# EasyEDA Pro project EdgeFouce_云台及电源管理.eprj, board PCB1
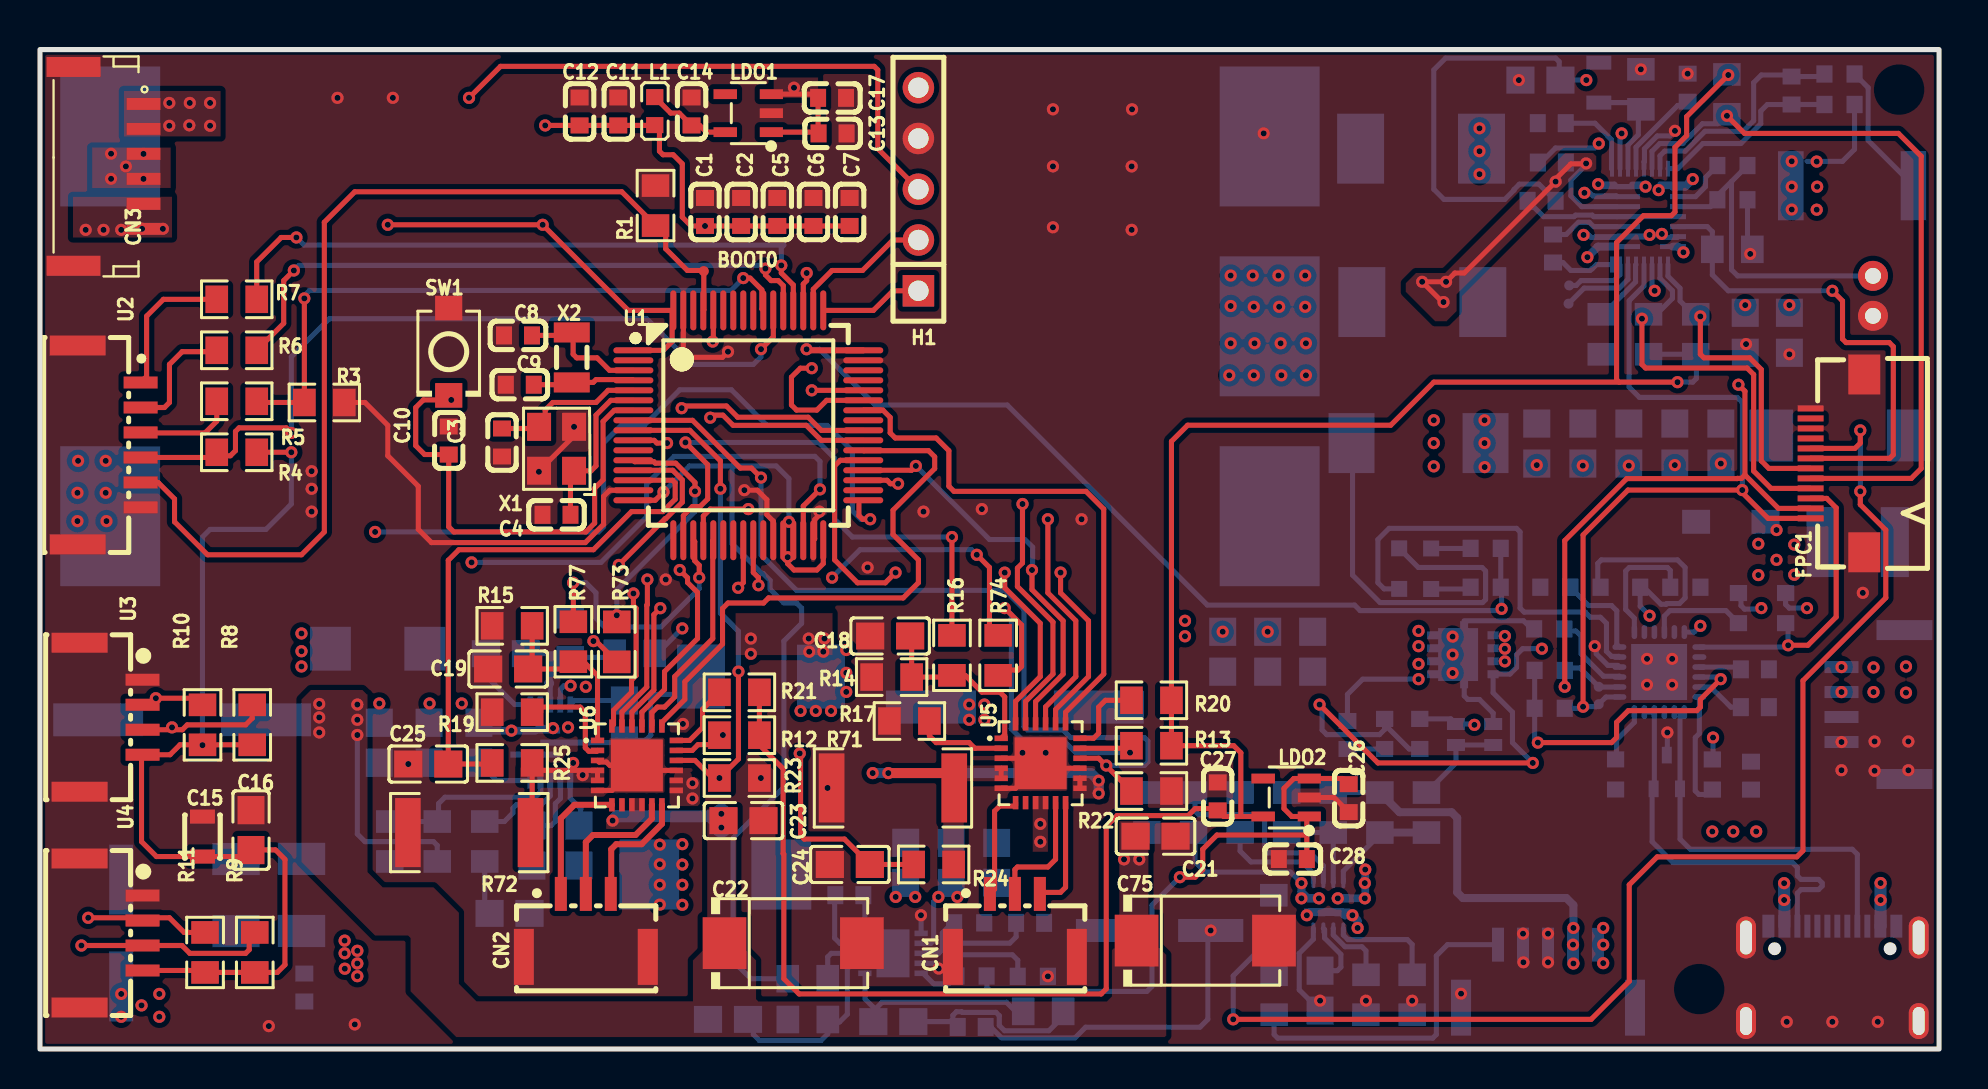
[diagram p5: board, top side]
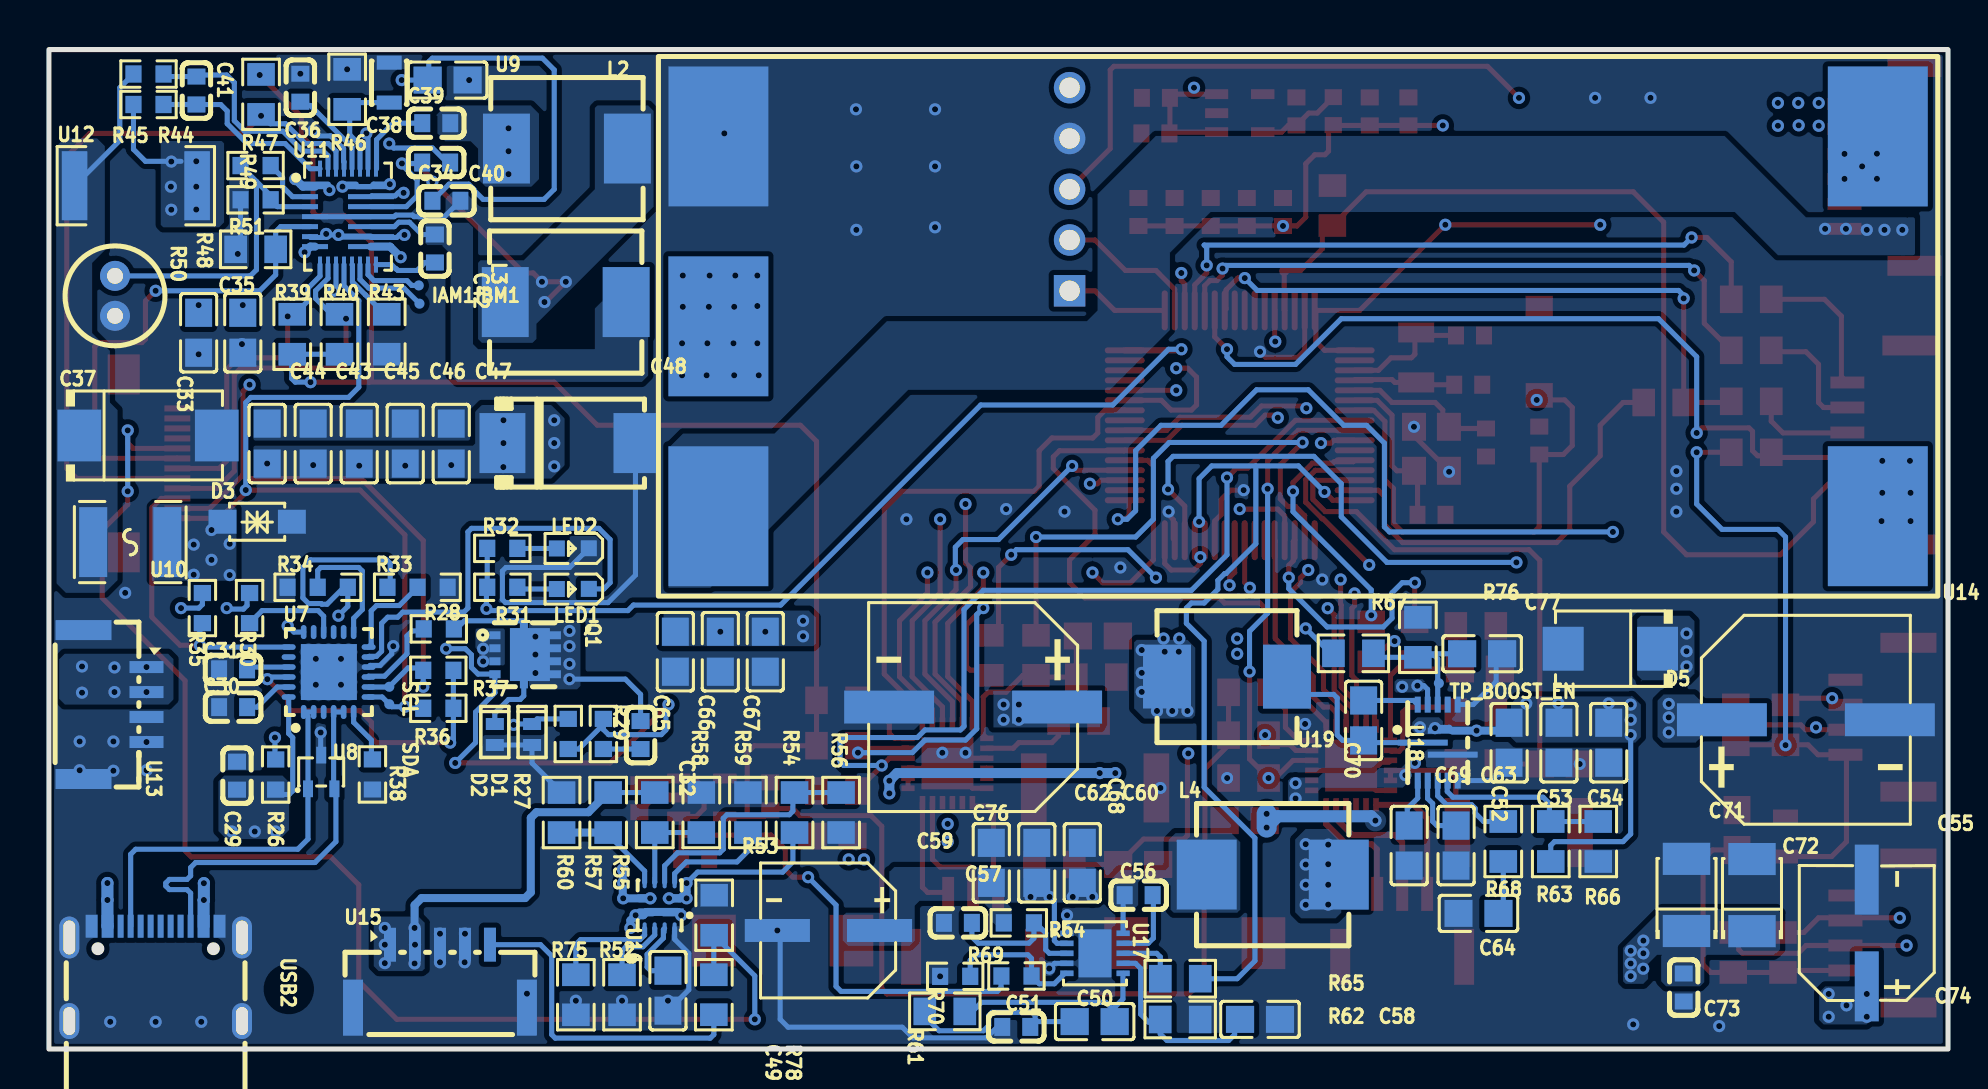
[diagram p6: board, bottom side, seen from below]

Outline 95 x 50 mm; copper layers: Top Layer, Inner1, Inner2, Bottom Layer. Coordinates in mm from the lower left corner of the outline.
Outline path: rectangle 0,50 95,0
Stack: Top Layer 0.035mm Outer layer thickness 1oz / Dielectric1 0.2104mm 7628 RC49% 8.6mil / Inner1 0.0152mm Inner layer thickness / Dielectric2 1.065mm 1.1mm H/HOZ Copper / Inner2 0.0152mm Inner layer thickness / Dielectric3 0.2104mm 7628 RC49% 8.6mil / Bottom Layer 0.035mm Outer layer thickness 1oz

## Design rules (mm)
net USB_CC1: DP1
net USB_CC2: DP1
spacing copperThickness1oz (default): track to track 0.102, other pairs 0.152 to 0.3
spacing copperThickness2oz: track to track 0.203, other pairs 0.152 to 0.3
track width copperThickness1oz (default): min 0.127, default 0.254, max 2.54
track width copperThickness2oz: min 0.203, default 0.254, max 2.54
differential pair differentialPair (default): width min 0.127, default 0.254, max 2.54; gap min 0.152, default 0.152
via viaSize (default): diameter min 0.5, default 0.61, max 10; hole min 0.3, default 0.305, max 6.3

## Placement (name value [footprint] x y rotation side)
BOOT0  -  [Test-Point-0.5mm]  33.21 38.92 270 top
C1  100nF  [C0603]  33.27 41.88 90 top
C2  100nF  [C0603]  35.07 41.88 90 top
C3  12pF  [C0603]  23.11 30.34 90 top
C4  12pF  [C0603]  25.84 26.73 0 top
C5  100nF  [C0603]  36.88 41.88 90 top
C6  100nF  [C0603]  38.69 41.88 90 top
C7  4.7uF  [C0603]  40.5 41.88 90 top
C8  12pF  [C0603]  23.91 35.7 0 top
C9  12pF  [C0603]  24 33.24 0 top
C10  100nF  [C0603]  20.45 30.44 270 top
C11  100nF  [C0603]  28.93 46.91 90 top
C12  1uF  [C0603]  26.99 46.91 90 top
C13  100nF  [C0603]  39.65 45.81 0 top
C14  100nF  [C0603]  32.59 46.91 90 top
C15  100nF  [CAP-SMD_L2.0-W1.25]  8.13 10.63 270 top
C16  1uF  [C0805]  10.56 10.95 270 top
C17  1uF  [C0603]  39.62 47.59 180 top
C18  100nF  [C0805]  42.53 20.67 180 top
C19  100nF  [C0805]  23.42 19.01 180 top
C21  330nF  [C0805]  55.8 10.65 180 top
C22  33uF  [CAP-SMD_L7.3-W4.3-FD]  37.68 5.3 0 top
C23  330nF  [C0805]  35.19 11.43 180 top
C24  1uF  [C0805]  40.51 9.23 0 top
C25  1uF  [C0805]  19.42 14.26 0 top
C26  100nF  [C0603]  65.47 12.55 270 top
C27  100nF  [C0603]  58.91 12.64 90 top
C28  1uF  [C0603]  62.67 9.5 0 top
C29  1uF  [C0603]  85.59 13.68 90 bottom
C30  1uF  [C0603]  85.78 17.1 0 bottom
C31  1uF  [C0603]  85.79 18.99 0 bottom
C32  100nF  [C0603]  65.4 15.71 90 bottom
C33  22uF  [C0805]  87.51 35.83 90 bottom
C34  1uF  [C0603]  75.12 42.44 180 bottom
C35  22uF  [C0805]  85.3 35.83 90 bottom
C36  10uF  [C0603]  82.42 48.09 90 bottom
C37  47uF  [CAP-SMD_L7.3-W4.3-FD]  90.04 30.7 180 bottom
C38  100nF  [CAP-SMD_L2.0-W1.25]  77.98 48.35 270 bottom
C39  470nF  [C0603]  75.63 46.32 180 bottom
C40  470nF  [C0603]  75.63 44.35 0 bottom
C41  100nF  [C0603]  87.62 47.95 90 bottom
C42  470nF  [C0603]  75.69 40.05 90 bottom
C43  22uF  [C0805]  81.78 30.29 270 bottom
C44  22uF  [C0805]  84.08 30.29 270 bottom
C45  22uF  [C0805]  79.48 30.29 270 bottom
C46  22uF  [C0805]  77.18 30.29 270 bottom
C47  22uF  [C0805]  74.87 30.29 270 bottom
C48  100uF  [CAP-SMD_L7.3-W4.3-L-FD]  68.96 30.31 180 bottom
C49  100nF  [C0805]  64.03 2.92 270 bottom
C50  22pF  [C0805]  42.69 1.37 0 bottom
C51  1.8nF  [C0603]  46.61 1.1 0 bottom
C52  22uF  [C0805]  21.96 15.32 90 bottom
C53  22uF  [C0805]  19.47 15.32 90 bottom
C54  22uF  [C0805]  16.97 15.32 90 bottom
C55  470uF  [CAP-SMD_BD10.0-L10.3-W10.3-LS11.0]  7.11 16.47 180 bottom
C56  100nF  [C0603]  40.49 7.7 180 bottom
C57  2.2uF  [C0603]  49.53 6.31 0 bottom
C58  22nF  [C0805]  34.42 1.48 180 bottom
C59  100uF  [CAP-SMD_BD6.3-L6.6-W6.6-RD]  56.01 5.93 180 bottom
C60  22uF  [C0805]  43.31 9.31 270 bottom
C62  100nF  [C0805]  45.58 9.31 270 bottom
C63  22uF  [C0805]  24.61 10.18 270 bottom
C64  6.8nF  [C0805]  23.49 6.79 0 bottom
C65  22uF  [C0805]  63.66 19.88 90 bottom
C66  22uF  [C0805]  61.41 19.88 90 bottom
C67  22uF  [C0805]  59.16 19.88 90 bottom
C68  470uF  [CAP-SMD_BD10.0-L10.3-W10.3-LS11.0]  48.77 17.11 0 bottom
C69  4.7uF  [C0805]  26.96 10.18 270 bottom
C70  100nF  [C0805]  29.23 16.44 90 bottom
C71  47uF  [CAP-SMD_L3.5-W2.8]  13.08 7.71 270 bottom
C72  47uF  [CAP-SMD_L3.5-W2.8]  9.81 7.7 270 bottom
C73  100nF  [C0603]  13.22 3.08 90 bottom
C74  220uF  [CAP-SMD_BD6.3-L6.6-W6.6-LS7.3-FD-H7.7]  4.06 5.8 90 bottom
C75  33uF  [CAP-SMD_L7.3-W4.3-FD]  58.29 5.42 0 top
C76  22uF  [C0805]  47.86 9.31 270 bottom
C77  10nF  [C0805]  23.31 19.78 180 bottom
CN1  WAFER-GH1.25-3PWB  [CONN-TH_3P-P1.25_GH1.25]  48.77 6.19 0 top
CN2  WAFER-GH1.25-3PWB  [CONN-TH_3P-P1.25_GH1.25]  27.31 6.19 0 top
CN3  SM06B-GHS-TB(LF)(SN)  [CONN-TH_SM06B-GHS-TB-LF-SN]  3.43 44.16 270 top
D1  ESDA25P35-1U1M  [DFN1610-2_L1.6-W1.0-P1.05-RD]  70.83 15.74 270 bottom
D2  ESDA25P35-1U1M  [DFN1610-2_L1.6-W1.0-P1.05-RD]  72.69 15.74 270 bottom
D3  SMF24CA  [SOD-123FL_L2.7-W1.8-LS3.8-BI]  84.58 26.38 180 bottom
D5  SMBJ15A  [SMB_L4.6-W3.6-LS5.3-RD]  16.89 20.03 0 bottom
FPC1  AFC01-S12FCA-00  [FPC-SMD_AFC01-S12FCA-00]  89.92 29.3 90 top
H1  2.54-1*5P母  [HDR-TH_5P-P2.54-V-F]  43.94 43.02 90 top
IAM1  -  [Test-Point-0.5mm]  76.5 38.2 90 bottom
IBM1  -  [Test-Point-0.5mm]  76.46 37.29 90 bottom
L1  BLM18KG601SN1D  [L0603]  30.75 46.92 270 top
L2  1.5uH  [IND-SMD_L7.5-W6.6_GSM0650]  69.09 45.05 180 bottom
L3  1.5uH  [IND-SMD_L7.5-W6.6_GSM0650]  69.15 37.37 180 bottom
L4  4.7uH  [IND-SMD_L7.5-W6.6]  33.78 8.72 180 bottom
LDO1  ME6211C33M5G-N  [SOT-23-5_L3.0-W1.7-P0.95-LS2.8-BL]  35.43 46.82 90 top
LDO2  ME6211C33M5G-N  [SOT-23-5_L3.0-W1.7-P0.95-LS2.8-BL]  62.34 12.58 90 top
LED1  XL-1608UBC-04  [LED0603-RD_BLUE]  68.79 23.02 0 bottom
LED2  XL-1608UBC-04  [LED0603-RD_BLUE]  68.79 25.05 0 bottom
Q1  STL9P3LLH6  [PDFN3333-8L_L3.2-W3.0-P0.65-LS3.3-BL_WILLSEMI_WNM3057XXXX]  71.19 19.72 270 bottom
R1  100kΩ  [R0805]  30.79 42.2 90 top
R3  100kΩ  [R0805]  14.22 32.35 0 top
R4  10kΩ  [R0805]  9.84 29.86 180 top
R5  100Ω  [R0805]  9.84 32.41 0 top
R6  22Ω  [R0805]  9.84 34.96 0 top
R7  22Ω  [R0805]  9.84 37.51 0 top
R8  4.7kΩ  [R0805]  10.62 16.22 270 top
R9  4.7kΩ  [R0805]  10.74 4.83 270 top
R10  4.7kΩ  [R0805]  8.13 16.22 270 top
R11  4.7kΩ  [R0805]  8.26 4.83 270 top
R12  10kΩ  [R0805]  34.99 15.7 0 top
R13  10kΩ  [R0805]  55.6 15.18 0 top
R14  10kΩ  [R0805]  42.6 18.61 0 top
R15  10kΩ  [R0805]  23.62 21.17 0 top
R16  56kΩ  [R0805]  45.62 19.7 270 top
R17  10kΩ  [R0805]  43.49 16.41 0 top
R19  10kΩ  [R0805]  23.62 16.85 0 top
R20  10kΩ  [R0805]  55.6 17.45 0 top
R21  10kΩ  [R0805]  34.99 17.85 0 top
R22  10kΩ  [R0805]  55.6 12.91 180 top
R23  10kΩ  [R0805]  34.99 13.56 180 top
R24  1kΩ  [R0805]  44.7 9.23 180 top
R25  1kΩ  [R0805]  23.62 14.31 180 top
R26  1K  [R0603]  83.66 13.73 270 bottom
R27  100K  [R0603]  69.02 15.76 90 bottom
R28  1K  [R0603]  75.5 21.02 180 bottom
R29  100Ω  [R0603]  67.26 15.76 90 bottom
R30  22K  [R0603]  84.96 22.06 90 bottom
R31  1k  [R0603]  72.32 23.1 0 bottom
R32  1k  [R0603]  72.32 25.05 0 bottom
R33  -  [0603*2]  74.42 22.44 0 bottom
R34  -  [0603*2]  83.69 23.76 180 bottom
R35  4.7K  [R0603]  87.32 22.06 90 bottom
R36  4.7K  [R0603]  75.52 17.05 180 bottom
R37  4.7K  [R0603]  75.52 18.95 180 bottom
R38  100K  [R0603]  78.82 13.74 90 bottom
R39  10kΩ  [R0805]  82.83 35.76 90 bottom
R40  14.7kΩ  [R0805]  78.1 35.76 90 bottom
R43  10kΩ  [R0805]  80.47 35.76 270 bottom
R44  2Ω  [R0603]  90.02 48.78 180 bottom
R45  2Ω  [R0603]  90.02 47.25 180 bottom
R46  100Ω  [R0805]  80.08 48.01 270 bottom
R47  10kΩ  [R0805]  84.39 47.76 90 bottom
R48  10kΩ  [R0805]  84.66 40.01 0 bottom
R49  13.7kΩ  [R0603]  84.66 44.2 0 bottom
R50  HNTC-104F3950FB  [RES-TH_BD2.5-P2.00_HNTC-103F3470FB]  91.69 37.68 270 bottom
R51  37.4kΩ  [R0603]  84.66 42.49 0 bottom
R52  30kΩ  [R0805]  66.33 2.72 270 bottom
R53  100kΩ  [R0805]  61.72 6.69 270 bottom
R54  137kΩ  [R0805]  57.7 11.83 270 bottom
R55  137kΩ  [R0805]  64.69 11.83 90 bottom
R56  10kΩ  [R0805]  55.37 11.83 90 bottom
R57  68kΩ  [R0805]  67.03 11.83 90 bottom
R58  10kΩ  [R0805]  62.36 11.83 270 bottom
R59  10kΩ  [R0805]  60.03 11.83 270 bottom
R60  10kΩ  [R0805]  69.36 11.83 270 bottom
R61  68kΩ  [R0805]  50.18 1.88 0 bottom
R62  4.7MΩ  [R0805]  38.41 1.48 180 bottom
R63  750kΩ  [R0805]  19.87 10.38 90 bottom
R64  10Ω  [R0603]  46.48 6.31 180 bottom
R65  10kΩ  [R0805]  38.41 3.52 180 bottom
R66  68.1kΩ  [R0805]  17.5 10.38 270 bottom
R67  1kΩ  [R0805]  29.74 19.8 180 bottom
R68  6.8kΩ  [R0805]  22.25 10.38 270 bottom
R69  52.3kΩ  [R0603]  46.6 3.65 180 bottom
R70  10kΩ  [R0603]  49.67 3.64 0 bottom
R71  330mΩ  [R2512]  42.67 13.06 0 top
R72  330mΩ  [R2512]  21.47 10.83 180 top
R73  1kΩ  [R0805]  28.85 20.37 90 top
R74  1kΩ  [R0805]  47.93 19.7 90 top
R75  100kΩ  [R0805]  68.64 2.72 90 bottom
R76  100kΩ  [R0805]  26.52 20.6 270 bottom
R77  56kΩ  [R0805]  26.68 20.38 270 top
R78  10kΩ  [R0805]  61.74 2.72 270 bottom
SCL  -  [Test-Point-0.5mm]  77.97 17.25 0 bottom
SDA  -  [Test-Point-0.5mm]  77.97 18.12 0 bottom
SW1  TS-1088-AR02016  [SW-SMD_L3.9-W3.0-P4.45]  20.45 34.89 270 top
TP_BOOST_EN  -  [Test-Point-0.5mm]  25.47 18.3 180 bottom
U1  STM32G431RBT6  [LQFP-64_L10.0-W10.0-P0.50-LS12.0-BL]  35.43 31.2 270 top
U2  WAFER-GH1.25-6PWB  [CONN-SMD_6P-P1.25_XUNPU_WAFER-GH1.25-6PWB]  3.46 30.22 270 top
U3  WAFER-GH1.25-4PWB  [CONN-SMD_4P-P1.25_XUNPU_WAFER-GH1.25-4PWB]  3.56 16.6 270 top
U4  WAFER-GH1.25-4PWB  [CONN-SMD_4P-P1.25_XUNPU_WAFER-GH1.25-4PWB]  3.56 5.8 270 top
U5  STSPIN830  [TQFN-24_L4.0-W4.0-P0.50-BL-EP2.6]  50.05 14.3 270 top
U6  STSPIN830  [TQFN-24_L4.0-W4.0-P0.50-BL-EP2.6]  29.86 14.19 270 top
U7  STUSB4500QTR  [QFN-24_L4.0-W4.0-P0.50-BL-EP2.8]  81.01 18.86 180 bottom
U8  ESDA25W  [SOT-323-3_L2.1-W1.3-P1.32-LS2.1-BR]  81.38 13.86 270 bottom
U9  22uF  [C0805]  75.06 48.48 180 bottom
U10  SMD1812-200-30  [F1812]  90.93 25.36 0 bottom
U11  MP2762AGV-0000-Z  [QFN-30_L5.0-W4.0-P0.50-TL_MP2762A]  80.29 41.64 180 bottom
U12  10mΩ  [R2512]  90.65 43.19 180 bottom
U13  BX-GH1.25-4PWT  [CONN-SMD_4P-P1.25_BX-GH1.25-4PWT]  91.69 17.23 270 bottom
U14  -  [2S均衡保护板]  32.51 36.16 0 bottom
U15  BX-GH1.25-5PWT  [CONN-SMD_5P-P1.25_BX-GH1.25-5PWT]  75.44 3.64 180 bottom
U16  TPS2121RUXR  [VQFN-HR-12_L2.5-W2.0-P0.50-BL]  64.45 7.19 90 bottom
U17  ST1S50PUR  [DFN-10_L3.0-W3.0-P0.50-BL-EP2.4-1]  42.67 4.79 270 bottom
U18  MP3429GL-Z  [QFN-13_L3.0-W4.0-P0.50-BL]  25.53 15.33 180 bottom
U19  1.5uH  [IND-SMD_L7.0-W6.6]  36.07 18.63 0 bottom
USB2  TYPE-C-31-M-48  [USB-TYPE-C-SMD_TYPE-C-31-M-48]  89.66 3.77 180 bottom
X1  8MHz  [OSC-SMD_4P-L3.2-W2.5-BL]  25.84 30.03 90 top
X2  32.768kHz  [FC-135R_L3.2-W1.5]  26.6 34.6 90 top

## Footprints (pads in the part's own frame, mm; a bottom-side part is the same pattern mirrored in y, then rotated)
2S均衡保护板
  rect 5x7 smd: 1(-29,9.5) 2(-29,-9.5) 3(29,9.5) 4(29,0) 5(29,-9.5)
0603*2
  rect 0.806x0.864 smd: 1(0.631,-0.66) 2(2.139,-0.66) 3(3.645,-0.66)
C0603
  rect 0.8x0.9 smd: 1(-0.7,0) 2(0.7,0)
C0805
  rect 1.41x1.35 smd: 1(-1,0) 2(1,0)
CAP-SMD_BD6.3-L6.6-W6.6-LS7.3-FD-H7.7
  rect 3.5x1.2 smd: 1(-2.67,0) 2(2.67,0)
CAP-SMD_BD6.3-L6.6-W6.6-RD
  rect 3.26x1.15 smd: 1(2.555,0) 2(-2.555,0)
CAP-SMD_BD10.0-L10.3-W10.3-LS11.0
  rect 4.5x1.65 smd: 1(-4.2,0) 2(4.2,0)
CAP-SMD_L2.0-W1.25
  rect 0.7x1.25 smd: 1(-1,0) 2(1,0)
CAP-SMD_L3.5-W2.8
  rect 1.607x2.376 smd: 1(1.804,0) 2(-1.804,0)
CAP-SMD_L7.3-W4.3-FD
  rect 2.185x2.592 smd: 1(-3.437,0) 2(3.437,0)
CAP-SMD_L7.3-W4.3-L-FD
  rect 2.3x3 smd: 1(-3.353,0) 2(3.353,0)
CONN-SMD_4P-P1.25_BX-GH1.25-4PWT
  rect 0.6x1.7 smd: 1(-1.875,1.575) 2(-0.625,1.575) 3(0.625,1.575) 4(1.875,1.575)
  rect 1x2.8 smd: 5(3.725,-1.575) 6(-3.725,-1.575)
CONN-SMD_4P-P1.25_XUNPU_WAFER-GH1.25-4PWB
  rect 0.6x1.7 smd: 1(-1.875,1.575) 2(-0.625,1.575) 3(0.625,1.575) 4(1.875,1.575)
  rect 1x2.8 smd: 5(3.725,-1.575) 6(-3.725,-1.575)
CONN-SMD_5P-P1.25_BX-GH1.25-5PWT
  rect 0.6x1.7 smd: 1(-2.5,1.575) 2(-1.25,1.575) 3(0,1.575) 4(1.25,1.575) 5(2.5,1.575)
  rect 1x2.8 smd: 6(4.35,-1.575) 7(-4.35,-1.575)
CONN-SMD_6P-P1.25_XUNPU_WAFER-GH1.25-6PWB
  rect 0.6x1.7 smd: 1(-3.125,1.575) 2(-1.875,1.575) 3(-0.625,1.575) 4(0.625,1.575) 5(1.875,1.575) 6(3.125,1.575)
  rect 1x2.8 smd: 7(4.975,-1.575) 8(-4.975,-1.575)
CONN-TH_3P-P1.25_GH1.25
  rect 0.6x1.7 smd: 1(-1.25,1.575) 2(0,1.575) 3(1.25,1.575)
  rect 1x2.8 smd: 4(3.1,-1.575) 5(-3.1,-1.575)
CONN-TH_SM06B-GHS-TB-LF-SN
  rect 0.6x1.7 smd: 1(-3.126,1.75) 2(-1.875,1.75) 3(-0.625,1.75) 4(0.625,1.75) 5(1.875,1.75) 6(3.124,1.75)
  rect 1x2.7 smd: 7(-4.974,-1.749) 8(4.974,-1.75)
DFN1610-2_L1.6-W1.0-P1.05-RD
  rect 0.6x0.9 smd: 1(-0.525,0) 2(0.525,0)
DFN-10_L3.0-W3.0-P0.50-BL-EP2.4-1
  rect 0.28x0.665 smd: 1(-1,-1.407) 2(-0.5,-1.407) 3(0,-1.407) 4(0.5,-1.407) 5(1,-1.407) 6(1,1.407) 7(0.5,1.407) 8(0,1.407) 9(-0.5,1.407) 10(-1,1.407)
  rect 2.4x1.65 smd: 11(0,0)
F1812
  rect 1.407x3.499 smd: 1(-1.853,0) 2(1.853,0)
FC-135R_L3.2-W1.5
  rect 1x1.8 smd: 1(-1.25,0) 2(1.25,0)
FPC-SMD_AFC01-S12FCA-00
  rect 0.3x1.3 smd: 1(-2.751,1.341) 2(-2.251,1.341) 3(-1.751,1.341) 4(-1.25,1.341) 5(-0.75,1.341) 6(-0.249,1.341) 7(0.251,1.341) 8(0.75,1.341) 9(1.249,1.341) 10(1.75,1.341) 11(2.249,1.341) 12(2.75,1.341)
  rect 2x1.6 smd: 13(-4.45,-1.34) 14(4.45,-1.341)
HDR-TH_5P-P2.54-V-F
  rect 1.575x1.575 hole 1.02: 1(-5.08,0)
  round 1.575 hole 1.02: 2(-2.54,0) 3(0,0) 4(2.54,0) 5(5.08,0)
IND-SMD_L7.0-W6.6
  rect 2.4x3.2 smd: 1(-3,0) 2(3,0)
IND-SMD_L7.5-W6.6
  rect 3x3.5 smd: 1(-3.302,0) 2(3.302,0)
IND-SMD_L7.5-W6.6_GSM0650
  rect 2.35x3.5 smd: 1(-3.025,0) 2(3.025,0)
L0603
  rect 0.8x0.864 smd: 1(-0.7,0) 2(0.7,0)
LED0603-RD_BLUE
  rect 0.8x0.8 smd: 1(-0.799,-0.004) 2(0.799,0.004)
LQFP-64_L10.0-W10.0-P0.50-LS12.0-BL
  oval 0.3x2 smd: 1(-3.75,-5.75) 2(-3.25,-5.75) 3(-2.75,-5.75) 4(-2.25,-5.75) 5(-1.75,-5.75) 6(-1.25,-5.75) 7(-0.75,-5.75) 8(-0.25,-5.75) 9(0.25,-5.75) 10(0.75,-5.75) 11(1.25,-5.75) 12(1.75,-5.75) 13(2.25,-5.75) 14(2.75,-5.75) 15(3.25,-5.75) 16(3.75,-5.75) 33(3.75,5.75) 34(3.25,5.75) 35(2.75,5.75) 36(2.25,5.75) 37(1.75,5.75) 38(1.25,5.75) 39(0.75,5.75) 40(0.25,5.75) 41(-0.25,5.75) 42(-0.75,5.75) 43(-1.25,5.75) 44(-1.75,5.75) 45(-2.25,5.75) 46(-2.75,5.75) 47(-3.25,5.75) 48(-3.75,5.75)
  oval 2x0.3 smd: 17(5.75,-3.75) 18(5.75,-3.25) 19(5.75,-2.75) 20(5.75,-2.25) 21(5.75,-1.75) 22(5.75,-1.25) 23(5.75,-0.75) 24(5.75,-0.25) 25(5.75,0.25) 26(5.75,0.75) 27(5.75,1.25) 28(5.75,1.75) 29(5.75,2.25) 30(5.75,2.75) 31(5.75,3.25) 32(5.75,3.75) 49(-5.75,3.75) 50(-5.75,3.25) 51(-5.75,2.75) 52(-5.75,2.25) 53(-5.75,1.75) 54(-5.75,1.25) 55(-5.75,0.75) 56(-5.75,0.25) 57(-5.75,-0.25) 58(-5.75,-0.75) 59(-5.75,-1.25) 60(-5.75,-1.75) 61(-5.75,-2.25) 62(-5.75,-2.75) 63(-5.75,-3.25) 64(-5.75,-3.75)
OSC-SMD_4P-L3.2-W2.5-BL
  rect 1.4x1.2 smd: 1(-1.1,-0.875) 2(1.1,-0.875) 3(1.1,0.875) 4(-1.1,0.875)
PDFN3333-8L_L3.2-W3.0-P0.65-LS3.3-BL_WILLSEMI_WNM3057XXXX
  rect 0.4x0.56 smd: 1(-0.975,-1.5) 2(-0.325,-1.5) 3(0.325,-1.5) 4(0.975,-1.5)
  rect 0.4x0.6 smd: 5(0.975,1.5) 6(0.325,1.5) 7(-0.325,1.5) 8(-0.975,1.5)
  rect 0.56x0.4 smd: 9(-1.4,-0.05) 9(1.4,-0.05)
  rect 2.65x2 smd: 9(-0.01,0.25)
QFN-13_L3.0-W4.0-P0.50-BL
  rect 2.5x0.3 smd: 1(-0.75,0) 7(0.75,-0.6) 8(0.75,0.6)
  rect 0.3x0.8 smd: 2(-1,-1.9) 3(-0.5,-1.9) 4(0,-1.9) 5(0.5,-1.9) 6(1,-1.9) 9(1,1.9) 10(0.5,1.9) 11(0,1.9) 12(-0.5,1.9) 13(-1,1.9)
QFN-24_L4.0-W4.0-P0.50-BL-EP2.8
  oval 0.28x0.7 smd: 1(-1.25,-2) 2(-0.75,-2) 3(-0.25,-2) 4(0.25,-2) 5(0.75,-2) 6(1.25,-2) 13(1.25,2) 14(0.75,2) 15(0.25,2) 16(-0.25,2) 17(-0.75,2) 18(-1.25,2)
  oval 0.7x0.28 smd: 7(2,-1.25) 8(2,-0.75) 9(2,-0.25) 10(2,0.25) 11(2,0.75) 12(2,1.25) 19(-2,1.25) 20(-2,0.75) 21(-2,0.25) 22(-2,-0.25) 23(-2,-0.75) 24(-2,-1.25)
  rect 2.8x2.8 smd: 25(0.013,0)
QFN-30_L5.0-W4.0-P0.50-TL_MP2762A
  rect 1.3x0.25 smd: 1(-1.4,1.5) 4(-1.4,0) 7(-1.4,-1.5)
  rect 0.8x0.25 smd: 2(-1.65,1) 3(-1.65,0.5) 5(-1.65,-0.5) 6(-1.65,-1)
  rect 0.2x0.8 smd: 8(-1.15,-2.4) 9(-0.75,-2.4) 10(-0.35,-2.4) 11(0.05,-2.4) 12(0.45,-2.4) 13(0.85,-2.4) 14(1.25,-2.4) 15(1.65,-2.4) 23(1.65,2.4) 24(1.25,2.4) 25(0.85,2.4) 26(0.45,2.4) 27(0.05,2.4) 28(-0.35,2.4) 29(-0.75,2.4) 30(-1.15,2.4)
  rect 2.3x0.25 smd: 16(1.4,-1.5) 17(1.4,-1) 18(1.4,-0.5) 19(1.4,0) 20(1.4,0.5) 21(1.4,1) 22(1.4,1.5)
R0603
  rect 0.806x0.864 smd: 1(-0.753,0) 2(0.753,0)
R0805
  rect 1.133x1.377 smd: 1(-1,0) 2(1,0)
R2512
  rect 1.282x3.456 smd: 1(-3.067,0) 2(3.067,0)
RES-TH_BD2.5-P2.00_HNTC-103F3470FB
  round 1.5 hole 0.8: 1(-1,0) 2(1,0)
SMB_L4.6-W3.6-LS5.3-RD
  rect 2.047x2.192 smd: 1(-2.361,0) 2(2.361,0)
SOD-123FL_L2.7-W1.8-LS3.8-BI
  rect 1.4x1.2 smd: 1(-1.735,0) 2(1.735,0)
SOT-23-5_L3.0-W1.7-P0.95-LS2.8-BL
  rect 0.49x1.157 smd: 1(-0.95,-1.153) 2(0,-1.153) 3(0.95,-1.153)
  rect 0.49x1.175 smd: 4(0.95,1.153) 5(-0.95,1.153)
SOT-323-3_L2.1-W1.3-P1.32-LS2.1-BR
  rect 0.835x0.5 smd: 1(0.843,-0.66) 2(0.843,0.66) 3(-0.843,0)
SW-SMD_L3.9-W3.0-P4.45
  rect 1.23x1.36 smd: 1(-2.185,0) 2(2.185,0)
Test-Point-0.5mm
  round 0.5 smd: 1(0,0)
TQFN-24_L4.0-W4.0-P0.50-BL-EP2.6
  rect 0.28x0.665 smd: 1(-1.25,-1.97) 2(-0.75,-1.97) 3(-0.25,-1.97) 4(0.25,-1.97) 5(0.75,-1.97) 6(1.25,-1.97) 13(1.25,1.97) 14(0.75,1.97) 15(0.25,1.97) 16(-0.25,1.97) 17(-0.75,1.97) 18(-1.25,1.97)
  rect 0.665x0.28 smd: 7(1.97,-1.25) 8(1.97,-0.75) 9(1.97,-0.25) 10(1.97,0.25) 11(1.97,0.75) 12(1.97,1.25) 19(-1.97,1.25) 20(-1.97,0.75) 21(-1.97,0.25) 22(-1.97,-0.25) 23(-1.97,-0.75) 24(-1.97,-1.25)
  rect 2.6x2.6 smd: 25(0,0)
USB-TYPE-C-SMD_TYPE-C-31-M-48
  oval 1x2.1 hole 0.6x1.7: 1(4.32,1.808) 4(-4.32,1.808)
  oval 1x1.8 hole 0.6x1.4: 2(4.32,-2.373) 3(-4.32,-2.373)
  rect 0.6x1.15 smd: A1B12(-3.2,2.373) A4B9(-2.4,2.373) B1A12(3.2,2.373) B4A9(2.4,2.373)
  rect 0.3x1.15 smd: A5(-1.25,2.373) A6(-0.25,2.373) A7(0.25,2.373) A8(1.25,2.373) B5(1.75,2.373) B6(0.75,2.373) B7(-0.75,2.373) B8(-1.75,2.373)
VQFN-HR-12_L2.5-W2.0-P0.50-BL
  rect 0.4x1.05 smd: 1(-0.35,-0.675)
  oval 0.4x1.05 smd: 2(0.35,-0.675) 7(0.35,0.675) 8(-0.35,0.675)
  oval 0.6x0.2 smd: 3(1.15,-0.75) 4(1.15,-0.25) 5(1.15,0.25) 6(1.15,0.75) 9(-1.15,0.75) 10(-1.15,0.25) 11(-1.15,-0.25) 12(-1.15,-0.75)

## Nets
As in the schematic.

Pads without a net: FPC1 9 11; LDO1 4; LDO2 4; U1 2 11 17 22 23 26 34 41 45 46 56 57 58 59 62; U5 8; U6 8; U7 3 15 17; U18 10; USB2 A6 A7 A8 B6 B7 B8

## Via types
v1: diameter 0.61, hole 0.305, Top Layer to Bottom Layer, 362 vias

## Routing (per net, layer and track width the routed paths; a pad name or vN(x,y) marks a point on that pad's centre or on a via; arc(x,y) is an arc through that point)
8.4V:
  vias: v1(1.91,29.43) v1(1.87,27.83) v1(1.87,26.41) v1(3.29,29.43) v1(3.29,27.83) v1(3.33,26.41) v1(6.47,47.33) v1(6.47,46.19) v1(7.49,47.33) v1(7.47,46.21) v1(8.51,47.33) v1(8.51,46.19)
GND: length 120.4
  Top Layer w0.254: U5.25 50.3,14.05 U5.15 ; U5.25 48.8,13.05 U5.6 ; U5.25 49.8,14.55 U5.3 ; v1(38.99,26.89) 38.99,26.72 38.75,26.48 38.75,25.53 U1.31 ; U6.3 27.97,14.36 28.34,14.36 28.51,14.19 U6.25 ; U1.63 32.18,34.93 32.51,34.6 34.13,34.6 v1(34.42,34.89) ; U6.25 28.61,12.94 U6.6 ; U6.25 30.11,13.94 U6.15 ; U1.27 36.68,26.41 36.36,26.73 36.36,27.48 35.88,27.96 v1(35.24,27.96) ; v1(26.72,31.13) 26.72,30.68 X1.4 ; U1.15 28.5,27.95 28.19,27.65 28.19,26.25 27.28,25.34 19.58,25.34 18.92,26 18.92,28.16 17.4,29.68 17.4,31.2 16.26,32.35 R3.2 ; LDO2.2 64.73,12.58 C26.2
  Bottom Layer w0.254: C49.2 62.99,2.96 62.99,4.79 63.7,5.5 U16.12 ; C77.2 22.61,19.48 22.61,18.38 23.75,17.23 24.52,17.23 U18.9 ; 80.24,44.04 80.24,44.39 80.26,44.41 80.26,45.04 80.9,45.68 81.53,45.68 v1(81.79,45.94) ; C34.2 75.21,41.64 76.74,41.64 76.81,41.72 77.65,41.72 77.72,41.64 U11.19 U11.4 ; C52.1 22.85,13.43 U18.6 ; R60.1 70.83,14.31 D1.2 72.69,15.21 ; v1(44.96,4.03) 44.7,4.29 U17.4 ; LED2.1 68.95,24.09 72.14,24.09 72.32,23.91 72.32,22.49 72.16,22.33 67.03,22.33 65.66,23.71 65.66,30.26 C48.2 ; U17.1 44.08,6.68 v1(44.07,6.69) ; v1(81.41,15.84) 81.41,14.73 U8.3 ; R48.2 85.42,40.25 R51.2 ; C51.2 47.56,1.1 48.1,0.56 51.78,0.56 52.31,1.09 58.03,1.09 58.42,1.49 58.42,5.79 v1(58.56,5.93) ; v1(77.78,20.16) 77.85,20.08 77.85,19.77 78.43,19.19 78.93,19.19 U7.10
  vias: v1(11.45,1.15) v1(13.59,28.91) v1(13.59,28.03) v1(13.59,26.89) v1(14.88,47.59) v1(15.75,1.23) v1(17.65,47.59) v1(18.42,14.26) v1(24.96,28.88) v1(31.3,23.49) v1(32.16,16.26) v1(36.06,13.56) v1(39.4,13.06) v1(41.4,24.09) v1(44.2,26.89) v1(47.12,27.01) v1(49.15,14.82) v1(50.31,14.82) v1(50.42,3.64) v1(50.67,47.01) v1(50.67,44.16) v1(50.67,41.11) v1(52.11,26.5) v1(54.63,47.01) v1(54.61,44.16) v1(54.61,40.98) v1(61.21,45.81) v1(64.03,2.42) v1(66.33,2.42) v1(68.64,2.42) v1(71.09,2.77) v1(73.98,48.48) v1(74.19,5.77) v1(74.21,4.34) v1(75.44,5.77) v1(75.44,4.34) v1(80.08,49.01) v1(80.39,19.52) v1(80.39,18.22) v1(81.65,19.52) v1(81.65,18.22) v1(82.42,48.8) v1(85.34,35.27) v1(85.55,39.78) v1(87.38,1.36) v1(87.51,34.76) v1(89.66,1.36) v1(90.12,15.36) v1(90.12,13.95) v1(91.19,22.82) v1(91.77,15.39) v1(91.77,13.92) v1(91.93,1.36) v1(93.46,15.39) v1(93.46,13.95)
VBUS: length 13
  Bottom Layer w0.254: R26.2 83.41,12.74 82.98,12.74 82.8,12.92 82.8,15.58 83.01,15.79 U7.24 ; v1(71.75,16.22) 71.71,16.26 70.83,16.26 70.58,16.52 R27.2
  Bottom Layer w0.6: USB2.B4A9 87.26,7.44 v1(87.25,7.45) v1(87.25,8.3) ; USB2.A4B9 92.07,6.16 v1(92.07,7.45) v1(92.07,8.3)
  vias: v1(73.28,20.66) v1(73.28,20.03) v1(73.28,19.39) v1(83.66,10.88) v1(84.7,10.88) v1(85.85,10.88)
VCC: length 269
  Top Layer w0.254: v1(25.27,46.21) C12.1 C11.1 30.74,46.21 L1.2 30.99,45.99 30.99,44.92 31.17,44.74 31.68,44.74 32.13,44.28 32.13,41.62 32.57,41.18 v1(33.27,41.18) C2.1 C5.1 C6.1 C7.1 ; U1.1 31.18,34.95 31.62,35.39 31.62,36.89 U1.64 29.43,36.95 v1(25.15,41.24) v1(17.4,41.24) ; v1(84.07,18.5) 83.06,17.49 83.06,17.11 82.88,16.93 79.45,16.93 78.87,16.34 78.87,15.58 78.61,15.33 v1(74.93,15.33) ; R8.2 R10.2 7,15.22 6.51,14.72 U3.4 5.08,14.67 5.08,10.38 5.83,9.63 C15.2 10.23,9.63 C16.2 10.57,9.96 11.78,9.96 12.26,9.49 12.26,4.22 11.87,3.83 R9.2 R11.2 8.16,3.93 U4.4 ; U1.32 39.18,24.29 38.86,23.97 37.72,23.97 37.4,24.28 v1(37.4,24.61) ; U1.16 30.78,27.45 v1(31.19,27.87) ; R4.1 v1(12.57,29.86)
  Top Layer w0.3: U1.48 38.4,34.95 v1(38.35,35.01)
  Inner2 w0.254: v1(25.27,46.21) 25.15,46.08 v1(25.15,41.24) ; v1(73.12,22.02) 74.21,22.02 74.29,21.93 74.29,15.96 v1(74.93,15.33) ; v1(80.52,21.68) 80.65,21.81 83.95,21.81 84.33,21.42 84.46,21.42 ; v1(12.57,29.86) 16.56,29.86 16.76,30.06 16.76,39.17 16.75,39.19 16.75,40.59 v1(17.4,41.24) ; v1(84.07,18.5) 84.07,21.04 84.46,21.42 ; 84.46,21.42 87.76,21.42 v1(88.39,22.06) ; H1.5 44.58,48.09 45.34,47.33 45.34,35.65 44.58,34.89 41.02,34.89
  Bottom Layer w0.254: 34.62,29.17 34.62,25.28 36.12,23.79 36.18,23.79 36.53,23.44 36.53,23 37.21,22.31 37.85,22.31 38.1,22.06 38.1,21.3 37.21,20.41 37.21,13.1 34.67,10.56 34.67,4.41 35.56,3.52 R65.2 ; 34.62,29.17 32.49,29.17 v1(31.19,27.87) ; 34.62,29.17 36.83,29.17 37.47,28.54 v1(37.47,26.38) ; v1(8.13,15.2) 8.13,25.62 8.51,26 11.3,26 12.57,27.27 v1(12.57,29.86) ; v1(38.35,35.01) 38.99,35.01 41.78,32.22 48.39,32.22 58.4,22.21 65.76,22.21 66.04,21.93 73.03,21.93 v1(73.12,22.02) 73.12,23.06 R31.2 R32.2 ; R35.2 87.32,22.24 87.5,22.06 v1(88.39,22.06) ; R37.2 R36.2 74.77,15.49 v1(74.93,15.33) ; v1(80.52,21.68) 80.05,22.15 R34.3 80.24,23.1 81.09,22.25 81.35,22.25 81.39,22.29 82.02,22.29 82.3,22.57 82.3,24.09 81.91,24.47 78.1,24.47 77.93,24.29 77.93,23.24 R33.3 ; U7.22 83.97,18.61 v1(84.07,18.5)
12_SYS: length 20.4
  Bottom Layer w0.254: R63.1 19.87,10.19 19.69,10.38 16.26,10.38 15.88,10.76 v1(15.88,15.71) ; U18.8 24.94,16.09 25.63,16.09 v1(25.66,16.06)
  Bottom Layer w0.4: C52.2 22.35,15.93 v1(23.58,15.93) U18.8
  Bottom Layer w0.6: v1(28.64,11.43) 28.86,11.65 33.52,11.65 v1(34.09,11.08)
  Bottom Layer w1: v1(34.09,11.08) v1(34.09,11.77)
  vias: v1(13.08,20.79) v1(13.08,19.9) v1(13.08,19.14) v1(13.97,17.27) v1(13.97,16.59) v1(13.97,15.84) v1(15.88,17.23) v1(15.88,16.47) v1(16.97,17.29) v1(19.49,17.29) v1(21.1,17.29) v1(26.42,16.09) v1(50.04,11.26) v1(50.04,10.37) v1(54.23,9.49) v1(54.99,9.49)
ADAPTER_IN: length 6.8
  Bottom Layer w0.254: U12.1 91.45,45.46 91.45,48.1 R44.1
ATTACH: length 21.4
  Bottom Layer w0.254: U7.11 78.97,19.65 78.61,19.65 78.36,19.9 78.36,21.3 78.05,21.6 77.55,21.6 77.3,21.86 74.24,21.86 74.04,22.06 74.04,25.87 73.86,26.05 67.49,26.05 66.93,25.49 66.93,23.33 67.24,23.02 LED1.1
BASE_12V: length 20.5
  Bottom Layer w0.254: R55.2 R57.2
  Bottom Layer w0.4: R57.2 68.01,11.85 70.61,11.85 70.9,11.57 70.9,7.84 71.18,7.55 76.36,7.55 76.71,7.2 v1(76.71,6.06) ; v1(66.29,8.98) 66.29,7.56 v1(66.27,7.54) v1(64.92,7.54)
  vias: v1(66.27,8.3) v1(76.69,5.22) v1(76.71,4.28) v1(78.2,6.06) v1(78.2,5.22) v1(78.2,4.3)
BASE_DET: length 68.4
  Top Layer w0.254: v1(91.06,30.95) 91.06,30.31 90.79,30.05 FPC1.8 ; v1(91.06,27.9) 91.06,27.24 92.34,25.96 92.34,22.57 88.19,18.43 88.19,9.92 87.88,9.61 80.9,9.61 79.5,8.22 79.5,3.39 77.6,1.49 v1(59.69,1.49)
  Bottom Layer w0.254: v1(91.06,27.9) v1(91.06,30.95) ; R78.1 61.74,5.68 R53.2 59.69,3.66 v1(59.69,1.49)
BAT_VCC: length 3.2
  Bottom Layer w0.4: v1(63.37,6.69) 63.54,6.86 65.11,6.86 65.27,6.69 v1(65.65,6.69) 65.91,6.43 v1(65.91,6.06)
  vias: v1(85.96,25.28) v1(85.96,23.71) v1(86.87,25.96) v1(86.87,24.47) v1(87.76,25.23) v1(87.76,23.73)
BATT: length 2.3
  Bottom Layer w0.4: U11.7 81.93,40.14 v1(82.21,39.86) ; U11.16 77.94,40.14 v1(77.41,39.62)
  vias: v1(59.49,33.71) v1(59.56,38.7) v1(59.56,37.17) v1(59.56,35.31) v1(60.66,38.7) v1(60.72,37.13) v1(60.72,33.71) v1(60.76,35.31) v1(61.95,38.7) v1(61.99,37.13) v1(62.06,35.31) v1(62.1,33.71) v1(63.29,38.7) v1(63.29,37.13) v1(63.33,35.31) v1(63.33,33.71) v1(85.3,37.22) v1(87.51,37.22)
BOOT0_CTRL: length 50.7
  Top Layer w0.254: U1.61 33.21,36.98 BOOT0.1 33.18,38.95 32.38,38.95 31.3,40.03 31.3,41.2 ; 5.03,28.34 5.91,28.34 6.73,27.52 6.73,26.38 8.38,24.73 13.08,24.73 14.22,25.87 14.22,41.36 15.75,42.89 29.1,42.89 R1.1
BST1: length 4.1
  Bottom Layer w0.254: C39.1 77.78,46.32 78.61,45.49 78.61,44.03
BST2: length 6.7
  Inner2 w0.254: v1(79.12,45.81) 79.12,45.56 78.87,45.3 v1(77.98,45.3)
  Bottom Layer w0.254: v1(79.12,45.81) 79.04,45.73 U11.24 ; C40.1 75.09,44.35 75.81,45.08 77.76,45.08 v1(77.98,45.3)
BST3: length 3.2
  Bottom Layer w0.254: 78.64,39.24 77.86,39.24 77.65,39.03 77.62,39.03 77.54,38.95 76.58,38.95 76.18,39.35 C42.1
BT:
  vias: v1(2.29,40.98) v1(3.18,40.98) v1(4.06,40.98) v1(5.11,41.03) v1(6.15,41.03)
CHG_ACOK_N: length 37.3
  Top Layer w0.254: FPC1.5 93.61,28.55 94.11,29.05 94.11,44.67 92.96,45.81 85.27,45.81 v1(84.39,46.69)
  Bottom Layer w0.254: R47.1 83.92,46.29 83.16,46.29 82.17,45.3 81.03,45.3 80.64,44.91 80.64,44.04
CHG_INT_N: length 19.6
  Top Layer w0.254: v1(80.14,36.54) 80.14,34.25 80.32,34.07 85.4,34.07 85.72,33.74 85.72,28.92 86.59,28.05 FPC1.4
  Bottom Layer w0.254: U11.9 81.04,38.56 81.66,37.94 81.66,37.55 80.87,36.76 R43.1
CHG_OTG_EN: length 25.3
  Top Layer w0.254: v1(89.66,37.94) 90.17,37.43 90.17,35.52 90.35,35.34 92.51,35.34 92.71,35.14 92.71,29.73 92.53,29.55 88.58,29.55 FPC1.7
  Bottom Layer w0.254: U11.5 83.41,41.14 83.66,40.89 R48.1 83.66,38.73 84.46,37.94 v1(89.66,37.94)
CHG_PROCHOT_N: length 15.6
  Top Layer w0.254: FPC1.6 86.48,29.05 86.11,29.43 86.11,34 85.52,34.58 83.24,34.58 83.06,34.76 83.06,36.65
  Bottom Layer w0.254: R39.2 82.71,36.76 82.04,37.43 82.04,38.06 81.44,38.67 U11.8
  vias: v1(83.06,36.65)
CP2: length 5.5
  Bottom Layer w0.254: U16.3 63.7,8.78 63.12,9.36 60.58,9.36 60.03,9.91 R59.2
DAC1_OUT1: length 28.1
  Top Layer w0.254: R16.1 v1(45.62,25.62) ; U1.18 32.18,26.68 32.64,27.14 33.02,27.14 33.4,27.52 33.4,29.23 v1(32.29,30.35)
  Bottom Layer w0.254: v1(32.29,30.35) 38.96,30.35 39.75,29.55 39.75,26.5 40.64,25.62 v1(45.62,25.62)
DAC1_OUT2: length 13.3
  Top Layer w0.254: U1.19 32.75,25.38 32.75,24.43 32.98,24.2 v1(32.98,23.58) ; v1(26.67,23.33) 26.68,23.32 R77.1
  Bottom Layer w0.254: v1(26.67,23.33) 27.31,23.33 27.81,22.82 27.81,21.55 28.25,21.12 31.06,21.12 32.98,23.03 v1(32.98,23.58)
DISCH: length 4.4
  Bottom Layer w0.254: 76.12,21.02 76.23,20.92 76.84,20.92 77.09,20.66 77.09,19.77 78.21,18.65 79.01,18.65 U7.9
EN_X: length 19.8
  Top Layer w0.254: R74.1 48.19,18.96 48.92,18.96 49.1,19.14 49.1,21.22 v1(48.26,22.06) ; v1(54.53,14.83) 54.31,15.05 U5.17
  Bottom Layer w0.254: v1(48.26,22.06) 48.59,21.73 48.59,16.02 49.15,15.46 51.18,15.46 51.81,14.83 v1(54.53,14.83)
EN_Y: length 20.6
  Top Layer w0.254: U6.17 32.63,14.94 32.92,15.23 33.51,15.23 R12.1 ; v1(27.69,20.41) 27.81,20.41 R73.1
  Inner2 w0.254: v1(27.69,20.41) 32.32,20.41 33.34,21.42 35.69,21.42 36.35,20.77 36.35,15.89 36.17,15.71 v1(34.16,15.71)
FB: length 7.1
  Bottom Layer w0.254: R70.1 48.91,4.44 48.64,4.71 46.03,4.71 45.85,4.53 R69.2 45.46,3.26 44.7,3.26 44.18,3.79 U17.5
FB_MP342: length 9.2
  Bottom Layer w0.254: R66.1 R63.2 19.94,11.45 19.94,12.28 20.26,12.6 24.77,12.6 25.05,12.88 25.05,13.41 U18.5
FOC_3.3V: length 119.5
  Top Layer w0.254: 78.99,33.36 v1(81.91,33.36) ; 78.99,33.36 69.72,33.36 67.57,31.21 57.41,31.21 56.6,30.4 R20.2 R13.2 59.72,15.18 60.07,14.82 60.07,11.77 ; 78.99,33.36 78.87,33.49 78.87,40.35 80.21,41.69 81.61,41.69 81.79,41.87 81.79,45.11 82.37,45.69 82.37,46.65 v1(84.46,48.73) ; R21.2 R12.2 35.99,15.21 37.18,14.02 37.18,9.78 37.21,9.74 37.21,3.52 37.97,2.76 53.09,2.76 53.34,3.01 53.34,11.14 53.88,11.68 57.44,11.68 57.78,12.03 58.82,12.03 C27.1 59.22,11.63 LDO2.5
  Bottom Layer w0.254: R43.2 R39.1 82.86,34.73 82.86,33.54 82.68,33.36 v1(81.91,33.36)
G431_ENABLE_IN: length 32.3
  Top Layer w0.254: v1(13.22,37.55) R3.1 10.9,32.35 R5.2 ; U1.55 36.11,37.03 36.11,37.98 35.52,38.57 v1(35.18,38.57)
  Bottom Layer w0.254: v1(13.22,37.55) 13.22,37.7 13.48,37.95 34.56,37.95 v1(35.18,38.57)
G431_FAULT_OUT: length 40.7
  Top Layer w0.254: v1(36.07,35.01) 36.68,35.63 U1.54 ; v1(12.57,30.82) 12.32,31.08 9.96,31.08 9.78,30.9 9.78,29.93 9.53,29.68 9.02,29.68 R4.2 8.58,29.6 U2.4
  Bottom Layer w0.254: v1(12.57,30.82) 12.57,34.63 14.48,36.54 30.35,36.54 32.64,34.25 35.69,34.25 36.07,34.63 v1(36.07,35.01)
G431_UART_RX: length 31.2
  Top Layer w0.254: R6.2 12.19,36.31 12.19,38.44 v1(12.7,38.95) ; U1.53 37.18,38.19 36.93,38.44 36.58,38.44 36.29,38.73 v1(36.29,39.05)
  Bottom Layer w0.254: v1(12.7,38.95) 12.95,39.2 36.13,39.2 v1(36.29,39.05)
G431_UART_TX: length 32.5
  Top Layer w0.254: v1(37.08,39.2) 37.08,38.82 37.68,38.22 U1.52 ; v1(12.83,40.6) 12.06,40.6 10.84,39.38 R7.2
  Bottom Layer w0.254: v1(12.83,40.6) 13.21,40.22 37.21,40.22 37.08,40.09 v1(37.08,39.2)
I2C1_SCL: length 54.6
  Top Layer w0.254: R10.1 7.8,17.55 v1(5.8,17.55) ; v1(38.35,38.82) 38.35,38.44 38.18,38.27 U1.51
  Inner2 w0.254: v1(38.35,38.82) 38.35,37.68 38.1,37.43 24.13,37.43 23.37,36.67 23.37,23.58 22.86,23.08 12.57,23.08 9.27,19.77 7.12,19.77 5.8,18.45 v1(5.8,17.55)
I2C1_SDA: length 52.2
  Top Layer w0.254: U1.60 33.68,35.42 v1(33.66,35.39) ; R8.1 10.62,16.55 10.29,16.22 7.37,16.22 7.12,15.97 U3.3
  Inner2 w0.254: v1(33.66,35.39) 27.1,35.39 27.07,35.42 24.55,35.42 24.37,35.24 24.37,23.07 23.37,22.06 12.83,22.06 12.19,21.42 12.19,19.52 11.43,18.76 8.64,18.76 7.75,17.87 7.75,16.34 7.49,16.09 v1(6.6,16.09)
I2C2_SCL: length 65
  Top Layer w0.254: v1(39.02,28) 38.18,27.17 U1.30 ; R11.1 7.21,5.83 6.48,6.57 5.27,6.57 U4.2 4.99,6.57 v1(2.41,6.57)
  Inner2 w0.254: v1(2.41,6.57) 2.41,18.89 4.57,21.04 9.14,21.04 12.45,24.35 v1(21.59,24.35)
  Bottom Layer w0.254: v1(21.59,24.35) 28.07,24.35 30.35,26.63 30.35,28.28 31.72,29.65 38.76,29.65 39.02,29.4 v1(39.02,28)
I2C2_SDA: length 78.9
  Top Layer w0.254: 40.97,27.27 40.97,26.68 41.15,26.5 v1(41.53,26.5) ; R9.1 10.47,5.56 10.47,4.97 10.29,4.79 7.49,4.79 7.1,5.18 U4.3 v1(2.07,5.18)
  Inner2 w0.254: v1(16.76,25.87) 12.32,25.87 8.76,22.31 3.43,22.31 1.02,19.9 1.02,6.06 1.89,5.18 v1(2.07,5.18)
  Bottom Layer w0.254: v1(41.53,26.5) 41.06,26.5 40.64,26.93 40.64,29.93 39.37,31.2 36.37,31.2 34.59,32.98 32,32.98 30.23,31.2 29.08,31.2 28.19,30.31 28.19,26.12 27.94,25.87 v1(16.76,25.87)
I2C_ADDR0: length 4.7
  Bottom Layer w0.254: R33.2 77.47,22.19 78.61,22.19 78.88,21.92 78.88,20.24 U7.12
I2C_ADDR1: length 6.4
  Bottom Layer w0.254: R34.2 81.55,23.94 81.41,24.09 79.5,24.09 79.32,23.91 79.32,21.99 79.76,21.55 U7.13
I2C_INT: length 15.6
  Top Layer w0.254: v1(87.45,20.2) 88.44,20.2 89.85,21.62 89.85,27.08 89.38,27.55 FPC1.3
  Bottom Layer w0.254: R35.1 87.45,21.18 v1(87.45,20.2) 87.36,20.11 U7.19
IAN: length 10
  Bottom Layer w0.254: R45.2 89.15,47.25 ; 89.15,47.25 87.37,47.25 ; 89.15,47.25 89.27,47.38 ; U11.30 81.93,44.04 83.19,45.3 85.09,45.3 86.08,46.3 86.08,46.93 86.41,47.25 C41.1
IAP: length 11.7
  Bottom Layer w0.254: R44.2 89.14,48.65 C41.2 87.54,48.73 86.11,48.73 85.72,48.35 85.72,46.44 85.22,45.94 85.21,45.94 85.19,45.92 83.29,45.92 82.3,44.92 81.27,44.92 81.04,44.69 U11.29
IN: length 38.2
  Inner2 w0.5: v1(77.95,43.27) 77.62,43.6 76.89,43.6 76.36,44.12 76.36,44.83 77.34,45.81 77.34,48.47 v1(77.35,48.48)
  Bottom Layer w0.254: C34.1 74.99,43.27 74,43.27 73.74,43 73.74,42.97 73.28,42.51 70.23,42.51 69.72,43.02 69.72,48.98 70.31,49.57 75.82,49.57 76,49.39 76,48.53 U9.1 v1(77.35,48.48) ; 80.19,43.27 79.63,43.27 ; R45.1 90.77,45.01 90.17,44.41 88.39,44.41 ; v1(77.95,43.27) 78.76,43.27 U11.22 79.63,43.14 ; 82.42,43.27 81.03,43.27
  Bottom Layer w0.4: v1(82.68,43.52) 82.3,43.14 U11.1
  vias: v1(80.32,43.14) v1(80.97,42.97) v1(87.63,44.41) v1(87.63,43.14) v1(87.63,42) v1(88.88,44.4) v1(88.9,43.14) v1(88.88,41.99)
IX: length 52
  Top Layer w0.254: v1(38,14.79) 38.05,14.75 38.05,10.68 38.23,10.5 40.24,10.5 C24.2 R24.2 ; v1(28.96,24.22) 31.27,26.53 31.3,26.53 32.13,27.36 32.13,28.47 31.65,28.95 U1.13
  Inner2 w0.254: v1(38,14.79) 38,14.92 37.36,15.56 37.36,15.58 36.96,15.98 36.96,22.52 36.53,22.96 36.53,23.89 34.65,25.76 34.65,31.98 33.4,33.24 29.72,33.24 28.96,32.47 v1(28.96,24.22)
IY: length 28
  Top Layer w0.254: R25.2 22.57,14.26 C25.2 20.42,24.45 20.95,24.98 27.69,24.98 29.59,26.89 31.15,26.89 31.78,27.51 31.78,28.33 31.65,28.45 U1.14
M1_INUH: length 27.1
  Top Layer w0.254: U1.42 41.19,31.97 42.16,31.97 42.53,31.6 42.53,30.82 42.78,30.57 44.83,30.57 45.47,29.93 45.47,28.16 45.72,27.9 52.32,27.9 53.21,27.01 53.21,18.76 51.3,16.85 U5.19
M1_INUL: length 22.6
  Top Layer w0.254: U1.35 42.37,28.45 42.54,28.28 v1(42.93,28.28) ; v1(51.05,23.84) 51.05,22.82 52.45,21.42 52.45,18.63 50.8,16.98 U5.20
  Inner2 w0.254: v1(51.05,23.84) 51.05,25.62 50.87,25.8 48.46,25.8 48.01,26.25 48.01,27.78 47.5,28.28 v1(42.93,28.28)
M1_INVH: length 36.9
  Top Layer w0.254: v1(50.42,26.5) 50.42,22.82 51.82,21.42 51.82,18.63 50.3,17.12 U5.21 ; v1(38.61,34.06) 38.04,34.06 37.59,33.62 37.59,32.22 37.85,31.97 38.86,31.97 39.35,32.45 U1.43
  Inner2 w0.254: v1(50.42,26.5) 50.42,33.36 49.72,34.06 v1(38.61,34.06)
M1_INVL: length 20.3
  Top Layer w0.254: v1(43.81,29.17) 43.6,28.95 U1.36 ; U5.22 49.8,17.38 51.18,18.76 51.18,21.42 49.62,22.98 v1(49.62,23.97)
  Bottom Layer w0.254: v1(49.62,23.97) 49.66,24 49.66,25.11 49.28,25.49 47.5,25.49 v1(43.81,29.17)
M1_INWH: length 31
  Top Layer w0.254: v1(49.15,27.27) 49.15,24.32 48.9,24.06 48.9,23.14 50.67,21.36 50.67,18.76 49.3,17.39 U5.23 ; U1.44 v1(38.61,32.95)
  Inner2 w0.254: v1(49.15,27.27) 49.15,32.57 48.77,32.95 v1(38.61,32.95)
M1_INWL: length 24.3
  Top Layer w0.254: v1(42.8,23.84) 42.29,23.32 40.9,23.32 39.75,24.47 39.75,29.17 40.03,29.45 U1.37 ; v1(48.26,23.83) 48.26,23.08 50.04,21.3 50.04,18.63 48.8,17.4 U5.24
  Inner2 w0.254: v1(42.8,23.84) 48.26,23.84 v1(48.26,23.83)
M2_INUH: length 28.9
  Top Layer w0.254: U1.38 41.2,29.93 44.45,29.93 44.76,29.63 44.76,29.04 42.67,26.96 42.67,25.74 43.94,24.47 43.94,23.33 43.18,22.57 36.45,22.57 36.19,22.31 34.42,22.31 34.14,22.04 34.14,20.26 32.26,18.38 32.26,17.49 31.11,16.34 U6.19
M2_INUL: length 10.8
  Top Layer w0.254: U1.21 33.66,25.43 33.66,20.54 31.75,18.63 31.75,17.61 31.24,17.11 30.88,17.11 30.61,16.83 U6.20
M2_INVH: length 26.2
  Top Layer w0.254: U1.39 39.08,30.45 38.33,31.2 34.67,31.2 34.16,31.71 33.66,31.71 v1(33.53,31.58) ; v1(32,23.97) 32.39,23.58 32.39,23.34 32.89,22.84 32.89,20.54 31.24,18.89 31.24,17.99 30.11,16.86 U6.21
  Inner2 w0.254: v1(32,23.97) 33.45,25.41 33.45,28.27 33.97,28.78 33.97,31.15 v1(33.53,31.58)
M2_INVL: length 13.3
  Top Layer w0.254: U1.24 35.18,23.33 v1(34.93,23.08) ; U6.22 29.61,16.86 30.71,17.96 30.71,21.73 v1(31.03,22.06)
  Inner2 w0.254: v1(34.93,23.08) 33.9,22.06 v1(31.03,22.06)
M2_INWH: length 28
  Top Layer w0.254: U6.23 29.11,16.86 30.35,18.11 30.35,22.2 30.38,22.23 v1(30.38,23.49) ; U1.40 41.18,30.95 39.09,30.95 38.43,31.61 34.9,31.61 34.34,32.17 32.21,32.17 v1(32.1,32.06)
  Inner2 w0.254: v1(32.1,32.06) 32,31.97 32,31.46 32.89,30.57 32.89,30.12 32.45,29.68 31.69,29.68 30.48,28.47 30.48,23.58 v1(30.38,23.49)
M2_INWL: length 16.7
  Top Layer w0.254: v1(29.69,22.79) 29.69,22.18 29.82,22.05 29.82,18.69 29.59,18.46 29.59,17.85 28.69,16.95 28.69,16.24 U6.24 ; v1(35.94,23.2) 35.94,23.58 35.68,23.84 U1.25
  Inner2 w0.254: v1(29.69,22.79) 33.62,22.79 34.6,23.76 35.81,23.76 35.94,23.64 v1(35.94,23.2)
MCU_5V: length 140.4
  Top Layer w0.254: 63.37,10.71 58.88,10.71 58.17,10 58.17,8.98 57.78,8.6 v1(57.02,8.6) ; 63.37,10.71 C28.2 ; 63.37,10.71 63.37,11.51 LDO2.1 62.62,11.63 62.23,12.03 62.23,13.04 62.72,13.53 LDO2.3 65.18,13.53 C26.1 ; LDO1.3 38.74,47.77 C17.2 38.92,45.83 ; 38.92,45.83 38.89,45.87 LDO1.1 ; 38.92,45.83 C13.1
  Inner2 w0.254: v1(57.02,8.6) 55.88,7.45 55.88,3.64 53.72,1.49 32.26,1.49 32.08,1.67 32.08,7.16 v1(32.13,7.22)
  Inner2 w0.5: v1(37.72,48.09) 32.19,48.09 31.12,47.02 31.12,40.6 31.75,39.97 39.22,39.97 39.88,39.31 39.88,37.3 38.81,36.23 35.5,36.23 35.12,35.86 35.12,34.59 34.36,33.83 28.92,33.83 28.07,32.98 28.07,23.2 24.51,19.65 24.51,17.74 25.27,16.98 26.67,16.98 30.1,13.55 30.1,10.88 30.75,10.22 v1(31.01,10.22)
  Bottom Layer w0.254: v1(57.02,8.6) 55.63,7.2 55.63,3.14 55.37,2.88 47.56,2.88 47.37,3.07 47.37,3.64 R69.1
  vias: v1(4.06,2.76) v1(4.06,1.61) v1(5.08,2.18) v1(5.97,2.76) v1(5.97,1.61) v1(15.24,5.42) v1(15.24,4.79) v1(15.25,4.02) v1(15.88,4.92) v1(15.88,4.28) v1(15.88,3.64) v1(31.01,9.24) v1(31.01,8.22) v1(31.01,7.22) v1(32.13,10.25) v1(32.13,9.23) v1(32.13,8.22)
NET13: length 3.3
  Bottom Layer w0.254: U11.12 79.82,39.22 79.82,38.38 79.17,37.73 79.17,37.73 78.55,37.11 78.46,37.11 R40.2
NRST: length 67.3
  Top Layer w0.254: v1(21.46,47.59) 23.04,49.16 41.73,49.16 41.91,48.98 41.91,45.05 H1.3 ; SW1.2 20.22,32.47 19.18,32.47 18.8,32.09 18.8,30.19 19.24,29.74 20.45,29.74 ; U1.7 28.73,31.95 28.17,31.4 28.17,28.48 27.75,28.05 27.75,26.31 27.31,25.87 20.7,25.87 20.45,26.12 C10.2
  Inner2 w0.254: v1(20.57,32.47) 21.46,33.36 21.46,47.58 v1(21.46,47.59)
NTC: length 16.1
  Bottom Layer w0.254: 84.62,43.4 R49.2 ; 84.62,43.4 83.91,42.69 R51.1 83.57,42.14 U11.3 ; 84.62,43.4 84.62,38.99 84.92,38.68 R50.1
OSC32_IN: length 6.5
  Top Layer w0.254: U1.3 28.49,33.95 27.87,34.58 26.85,34.58 26.67,34.76 26.67,35.78 X2.2 26.45,35.7 C8.2
OSC32_OUT: length 5.1
  Top Layer w0.254: C9.2 26.49,33.24 X2.1 27.67,33.35 27.81,33.49 29.65,33.49 U1.4
OSC_IN: length 7.7
  Top Layer w0.254: C3.2 24.88,31.05 24.97,31.13 25.27,31.44 25.27,31.97 25.65,32.35 27.81,32.35 28.42,32.95 U1.5
OSC_OUT: length 8.2
  Top Layer w0.254: C4.2 26.54,28.75 X1.1 27.57,28.93 27.81,29.17 27.81,31.71 28.56,32.45 U1.6
OV:
  vias: v1(3.56,44.79) v1(3.56,43.54) v1(4.3,44.16) v1(5.18,44.78) v1(5.18,43.53)
OV1: length 4.8
  Bottom Layer w0.254: R58.2 R55.1 64.69,8.34 U16.5
OV2: length 12.6
  Bottom Layer w0.254: R56.2 R54.1 57.78,12.75 57.78,11.9 57.96,11.72 61.09,11.72 61.27,11.54 61.27,10 61.45,9.82 63.55,9.82 64.2,9.17 U16.4
PC2: length 17.2
  Top Layer w0.254: v1(31.37,30.31) 30.86,30.31 30.72,30.45 U1.10
  Inner2 w0.254: v1(32.13,21.04) 30.35,21.04 28.83,22.57 28.83,23.27 29.54,23.98 29.54,29.88 29.97,30.31 v1(31.37,30.31)
  Bottom Layer w0.254: v1(32.13,21.04) 30.88,19.8 R67.1
PWR_I2C4_SCL: length 41.3
  Top Layer w0.254: v1(77.19,17.12) 77.19,25.72 79.44,27.97 v1(85.15,27.97) 85.15,27.84 86.44,26.55 FPC1.1
  Bottom Layer w0.254: 80.24,39.24 80.24,38.18 79.5,37.44 79.5,33.11 80.01,32.6 84.9,32.6 85.15,32.35 v1(85.15,27.97) ; U7.7 78.33,17.61 SCL.1 77.85,17.12 v1(77.19,17.12) 77.11,17.05 R36.1
PWR_I2C4_SDA: length 41.5
  Top Layer w0.254: 85.29,28.72 85.29,32.91 v1(84.96,33.24) ; 85.29,28.72 85.12,28.55 84.91,28.55 84.9,28.54 79.38,28.54 76.27,25.44 v1(76.27,18.12) ; 85.29,28.72 86.96,27.05 FPC1.2
  Inner2 w0.254: v1(80.77,37.94) 80.72,37.88 80.72,32.6 84.33,32.6 v1(84.96,33.24)
  Bottom Layer w0.254: R37.1 v1(76.27,18.12) ; 80.64,39.24 80.64,38.07 v1(80.77,37.94) ; 76.27,19.06 77.04,19.06 SDA.1 77.99,18.11 U7.8
RST: length 2.8
  Bottom Layer w0.254: U7.6 79.76,16.35 78.87,15.46 78.87,14.54 R38.2
SNS_X: length 16.9
  Top Layer w0.254: U5.14 U5.13 ; U5.5 U5.4
  Top Layer w0.5: v1(42.44,13.81) 45.34,13.81 45.73,13.41 R71.2
  Bottom Layer w0.5: v1(41.66,13.81) v1(42.44,13.81) 52.58,13.81 v1(52.96,13.42) v1(52.96,12.79)
SNS_Y: length 7.4
  Top Layer w0.254: U6.5 U6.4 25,13.94 R25.1 24.62,10.91 R72.1
  vias: v1(26.67,14.31) v1(27.15,13.7) v1(32.64,13.3) v1(32.64,12.53)
STBY_X: length 44.5
  Top Layer w0.254: R22.2 52.96,14.55 U5.16 ; v1(36.07,28.59) 35.59,29.07 35.03,29.07 32.64,31.45 U1.8
  Bottom Layer w0.254: v1(53.34,14.19) 55.25,14.19 55.42,14.37 55.42,15.4 55.25,15.58 51.56,15.58 51.18,15.96 49.4,15.96 49.22,16.14 49.22,21.99 48.26,22.95 37.85,22.95 36.07,24.73 v1(36.07,28.59)
STBY_Y: length 24.1
  Top Layer w0.254: v1(34.94,18.89) 34.94,14.51 v1(33.99,13.56) 33.65,13.56 32.77,14.44 U6.16 ; U1.9 32.51,30.95 34.04,29.43 v1(34.04,28.03)
  Bottom Layer w0.254: v1(34.94,18.89) 34.94,20.9 34.04,21.81 v1(34.04,28.03)
SW: length 1.9
  Bottom Layer w0.254: C56.1 41.26,7.62 U17.10
SW1: length 10.2
  Inner2 w0.254: v1(77.26,42.83) 77.03,42.61 72.54,42.61 72.01,43.14 v1(72.01,43.77) v1(72.01,44.92) v1(72.01,46.06)
  Bottom Layer w0.254: v1(77.26,42.83) 77.53,42.83 77.68,42.69 78.85,42.69 U11.21
SW2: length 17.7
  Top Layer w0.254: v1(70.21,37.37) 70.16,37.37 v1(69.14,38.38) v1(70.34,38.38) 70.78,38.82 71.25,38.82 v1(75.82,43.4) 75.82,43.52 76.58,44.28 77.32,44.28 v1(77.34,44.3)
  Bottom Layer w0.254: v1(77.34,44.3) 76.38,44.3 C40.2 ; 77.35,44.24 76.58,43.48 76.58,42.69 77.12,42.14 U11.20
SW3: length 3.5
  Bottom Layer w0.254: C42.2 76.35,40.75 76.96,41.36 77.5,41.36 77.72,41.14 U11.18
SWCLK: length 7.3
  Top Layer w0.254: U1.50 38.68,38.01 39.62,38.95 41.15,38.95 42.67,40.47 H1.2
SWDIO: length 5.2
  Top Layer w0.254: H1.1 42.67,37.94 41.69,36.95 U1.49
SYS: length 9.3
  Bottom Layer w0.254: v1(77.22,40.73) 77.47,40.73 77.6,40.6 78.85,40.6 U11.17 ; U18.12 26.03,17.24 26.03,18 26.21,18.18 v1(26.54,18.18) ; U17.2 44.57,5.29 44.7,5.42 44.7,7.37 v1(44.94,7.61) ; U11.6 81.9,40.6 81.31,40.6 v1(81.13,40.78) 81.08,40.73 v1(80.52,40.73)
  Bottom Layer w0.3: v1(80.52,40.73) 80.43,40.64 U11.17
  vias: v1(27.31,18.12) v1(35.56,20.54) v1(35.56,19.77) v1(38.05,16.91) v1(38.45,20.54) v1(38.48,19.88) v1(38.81,16.91) v1(39.24,20.54) v1(39.19,19.88) v1(39.57,16.91) v1(40.33,19.96) v1(40.33,18.82) v1(40.33,17.87) v1(42.81,7.61) v1(43.78,7.61) v1(45.89,7.61) v1(46.48,17.23) v1(46.48,16.47) v1(47.24,17.23) v1(47.24,16.47) v1(57.28,21.42) v1(57.28,20.65) v1(59.16,20.88) v1(61.41,20.88) v1(69.72,31.46) v1(69.72,30.31) v1(69.72,29.15) v1(72.26,31.46) v1(72.26,30.31) v1(72.27,29.11) v1(74.87,29.21) v1(77.18,29.19) v1(79.48,29.19) v1(81.78,29.21) v1(84.08,29.29) v1(90.12,19.11) v1(90.12,17.86) v1(91.72,19.09) v1(91.72,17.86) v1(93.34,19.14) v1(93.34,17.83)
U_X: length 5.5
  Top Layer w0.254: U5.7 48.8,12.19 48.77,12.15 48.01,12.15 47.75,11.9 47.75,7.99 CN1.1
U_Y: length 6.6
  Top Layer w0.3: U6.7 26.73,12.22 26.06,11.54 CN2.1
USB_CC1: length 19.7
  Bottom Layer w0.254: USB2.A5 90.91,9.74 90.66,10 82.55,10 82.04,10.5 82.04,13.02 U8.1 82.04,16.64 U7.1 U7.2
USB_CC2: length 19.8
  Bottom Layer w0.254: USB2.B5 87.91,7.8 88.09,7.98 88.97,7.98 89.15,8.16 89.15,8.31 88.97,8.48 88.09,8.48 87.91,8.66 87.91,9.08 87.66,9.33 81.69,9.33 80.65,10.38 80.65,12.94 U8.2 80.76,13.06 U7.4 U7.5
V_X: length 6.3
  Top Layer w0.254: CN1.2 48.77,8.98 48.9,9.11 50.42,9.11 50.8,9.49 U5.11
V_Y: length 7.1
  Top Layer w0.3: CN2.2 27.31,10.35 27.66,10.71 29.79,10.71 30.61,11.52 30.61,12.22 U6.11
VNTC: length 2.9
  Bottom Layer w0.254: R49.1 83.31,43.6 83.31,43.14 82.81,42.64 U11.2
VSINK: length 20.5
  Bottom Layer w0.254: v1(68.96,18.5) 66.17,18.5 65.4,17.74 C32.2 ; 72.69,16.26 72.69,16.8 72.01,17.49 71.43,17.49 71.25,17.67 71.25,18.32 Q1.9 ; 74.62,21.02 74.21,21.42 71.24,21.42 ; R54.2 57.78,10.75 57.78,9.36 58.29,8.85 62.55,8.85 v1(63.1,8.3)
  Bottom Layer w0.4: v1(63.1,8.3) 63.1,7.85 63.42,7.54 v1(63.98,7.54)
  vias: v1(63.1,7.54) v1(68.96,20.92) v1(68.96,20.16) v1(68.96,19.27) v1(70.66,20.63) v1(70.66,19.73) v1(70.66,18.81)
VUBS_DISCH: length 7.9
  Inner2 w0.254: v1(83.69,15.58) 83.69,18 83.06,18.63 v1(83.06,21.17)
  Bottom Layer w0.254: R26.1 83.69,14.52 v1(83.69,15.58) ; v1(83.06,21.17) 82.75,20.86 U7.18
VUBS_EN_SINK: length 4.9
  Bottom Layer w0.254: U7.16 81.26,21.66 81.53,21.93 84.34,21.93 R30.1
W_X: length 5.7
  Top Layer w0.254: CN1.3 50.09,7.84 51.05,7.84 51.3,8.09 U5.12
W_Y: length 6.3
  Top Layer w0.3: U6.12 31.11,12.22 31.11,11.26 30.1,10.25 28.83,10.25 28.57,10 28.57,7.78 CN2.3
$1N17: length 4.3
  Top Layer w0.254: L1.1 31.55,46.83 31.98,46.83 C14.1 33,46.21 33.34,45.87 LDO1.5
$1N249: length 7.3
  Top Layer w0.254: R7.1 6.18,37.51 5.33,36.67 5.33,33.64 U2.1
$1N250: length 6.1
  Top Layer w0.254: U2.2 6.23,32.1 6.48,32.35 6.48,34.25 7.11,34.89 8.77,34.89 R6.1
$1N251: length 5.1
  Top Layer w0.254: U2.3 5.06,30.82 8.25,30.82 8.84,31.41 R5.1
$1N261: length 11.8
  Top Layer w0.254: U1.12 29.75,29.38 30.71,29.38 30.78,29.31 31.8,29.31 32.77,28.34 v1(32.77,27.9)
  Bottom Layer w0.254: v1(32.77,27.9) 32.77,26.89 28.85,22.97 v1(28.85,21.7)
$1N263: length 22.5
  Top Layer w0.254: v1(46.86,24.73) 47.5,24.09 47.5,21.13 R74.2 ; v1(35.43,27.01) 33.53,27.01 33.18,26.67 U1.20
  Inner2 w0.254: v1(35.43,27.01) 35.43,25.49 37.34,23.58 v1(39.62,23.58)
  Bottom Layer w0.254: v1(39.62,23.58) 41.02,24.98 46.61,24.98 v1(46.86,24.73)
$2N83: length 4.6
  Top Layer w0.254: U5.2 46.76,15.05 46.48,15.33 44.83,15.33 44.49,15.67 R17.2
$2N84: length 5.3
  Top Layer w0.254: R19.2 24.88,17.11 27.03,17.11 27.28,16.85 27.28,15.08 27.46,14.9 27.85,14.9 U6.2
$2N91: length 4.1
  Top Layer w0.254: R20.1 53.3,17.45 52.96,17.11 52.96,15.8 52.71,15.55 U5.18
$2N94: length 3.7
  Top Layer w0.254: U6.18 32.49,15.44 33.14,16.09 33.14,17 R21.1
$2N117: length 9.4
  Top Layer w0.254: U5.1 48.26,15.72 48.26,17.61 48.02,17.85 47.13,17.85 46.28,18.7 R16.2 45.53,18.61 R14.2 43.6,20.59 C18.1
$2N120: length 9.5
  Top Layer w0.254: U6.1 27.89,18.68 27.19,19.38 R77.2 26.32,19.01 24.67,19.01 24.62,18.96 ; 24.62,18.96 24.42,18.76 ; 24.62,18.96 R15.2
$3N13: length 2
  Bottom Layer w0.254: R32.1 71.56,25.04 LED2.2
$3N18: length 42.8
  Top Layer w0.254: v1(74.68,14.31) 66.93,14.31 v1(64.01,17.23)
  Inner2 w0.254: v1(86.11,22.06) 85.85,22.31 75.56,22.31 75.13,21.88 v1(75.13,20.03)
  Bottom Layer w0.254: R30.2 85.09,22.69 85.09,22.19 85.27,22.01 86.06,22.01 v1(86.11,22.06) ; v1(74.68,14.31) 73.66,15.33 73.66,16.85 72.69,17.82 Q1.4 72.7,18.76 73.53,18.76 73.86,19.09 73.86,19.72 74.17,20.03 v1(75.13,20.03) ; 67.26,16.24 68.49,15.01 R27.1 ; 67.26,16.24 R29.2 ; 67.26,16.24 67.26,15.99 67.01,15.73 64.37,15.73 64.13,15.96 64.13,17.11 v1(64.01,17.23)
$3N21: length 1.9
  Bottom Layer w0.254: R29.1 67.26,15.01 C32.1
$3N24: length 2
  Bottom Layer w0.254: LED1.2 71.48,23.01 R31.1
$3N63: length 2.1
  Bottom Layer w0.254: U7.21 84.97,19.11 C31.1
$3N64: length 2.5
  Bottom Layer w0.254: C30.1 84.58,17.1 83.58,18.11 U7.23
$4N1: length 4.2
  Bottom Layer w0.254: IBM1.1 77.24,38.07 79,38.07 79.44,38.51 U11.13
$4N2: length 3.3
  Bottom Layer w0.254: U11.14 79.04,38.74 78.74,38.44 77.09,38.44 76.85,38.2 IAM1.1
$4N4: length 5.4
  Bottom Layer w0.254: R46.2 79.75,47.35 C38.2 ; U11.25 79.44,45.23 79.96,45.74 79.96,47.01
$4N24: length 4.6
  Bottom Layer w0.254: U11.26 79.84,45.12 81.92,47.21 82.23,47.21 C36.1
$5N22: length 5.6
  Bottom Layer w0.254: U16.6 65.2,8.9 67.03,10.73 R57.1
  Bottom Layer w0.4: R60.2 R57.1
$5N30: length 3.5
  Bottom Layer w0.254: R52.1 66.33,4.92 66.13,5.12 65.28,5.12 64.69,5.71 64.69,6.03 U16.10
$5N32: length 3.4
  Bottom Layer w0.254: U16.11 64.26,5.98 64.26,5.55 65.08,4.74 65.08,4.1 64.9,3.92 C49.1
$5N36: length 3
  Bottom Layer w0.254: U17.8 39.59,4.79 39.41,4.61 R65.1
$5N45: length 9.2
  Bottom Layer w0.254: 45.67,1.35 45.67,1.69 45.85,1.87 46.1,1.87 46.13,1.83 47.82,1.83 47.99,1.67 47.99,1.18 48.25,0.91 50.47,0.91 51.18,1.63 ; 45.67,1.35 45.64,1.37 C50.2 ; 45.67,1.35 45.91,1.1
$5N46: length 10.6
  Bottom Layer w0.254: 41.69,1.9 C50.1 ; 41.69,1.9 41.69,2.09 41.28,2.5 41.28,3.78 U17.6 ; 41.69,1.9 42.13,2.34 48.35,2.34 49.18,1.5
$5N50: length 9.5
  Bottom Layer w0.254: 39.41,1.35 39.41,0.76 39.07,0.43 35.98,0.43 35.69,0.72 35.69,1.09 ; 39.41,1.35 40,1.35 40.39,1.74 40.39,4.03 40.65,4.29 U17.7 ; 39.41,1.35 R62.1
$5N60: length 7.6
  Bottom Layer w0.254: C57.1 48.83,5.61 48.51,5.3 45.97,5.3 45.73,5.54 R64.2 45.65,6.31 45.14,5.8 45.14,4.97 44.96,4.79 U17.3
$5N61: length 3.8
  Bottom Layer w0.254: C56.2 39.75,7.66 39.75,5.55 40.01,5.29 U17.9
$5N70: length 7.7
  Bottom Layer w0.254: C77.1 26.34,19.78 26.42,19.7 25.71,19.7 25.53,19.52 U18.11 ; R67.2 28.54,19.6 R76.2
$5N72: length 2.7
  Bottom Layer w0.254: R68.2 22.25,7.03 C64.1
$5N73: length 4.7
  Bottom Layer w0.254: U18.4 25.53,12.66 25.09,12.22 23.83,12.22 23.65,12.04 23.65,11.81 23.23,11.38 R68.1
$5N74: length 3.4
  Bottom Layer w0.254: U18.3 26.03,13.42 26.03,12.53 25.78,12.28 25.78,11.39 25.57,11.18 C63.1
$5N75: length 2.8
  Bottom Layer w0.254: C70.2 26.74,17.44 U18.13
$5N78: length 2.5
  Bottom Layer w0.254: U18.2 26.53,12.55 27.05,12.03 27.05,11.27 C69.1
$5N84: length 9.3
  Bottom Layer w0.254: 33.07,18.79 32.03,17.74 30.73,17.74 30.55,17.56 30.55,15.71 30.28,15.44 C70.1 29.12,15.33 U18.1
$5N100: length 5.5
  Bottom Layer w0.254: R75.2 68.64,5.23 68.4,5.47 65.43,5.47 65.2,5.7 U16.9
$5N105: length 16.5
  Bottom Layer w0.254: U15.5 70.41,5.22 69.85,4.66 69.85,0.72 69.67,0.54 61.92,0.54 61.74,0.72 R78.2

## Copper pours and planes (outline as drawn; the poured copper is in the pictures)
8.4V on Top Layer: 4.2,47.93 9.03,47.93 9.03,45.66 4.2,45.66
8.4V on Inner2: 1.18,49.66 11.81,49.66 11.81,23.2 1.18,23.2
